# Altium schematic sheet Boost_Section.SchDoc
size A; DocumentNumber: 4; SheetNumber: 4; SheetTotal: 6
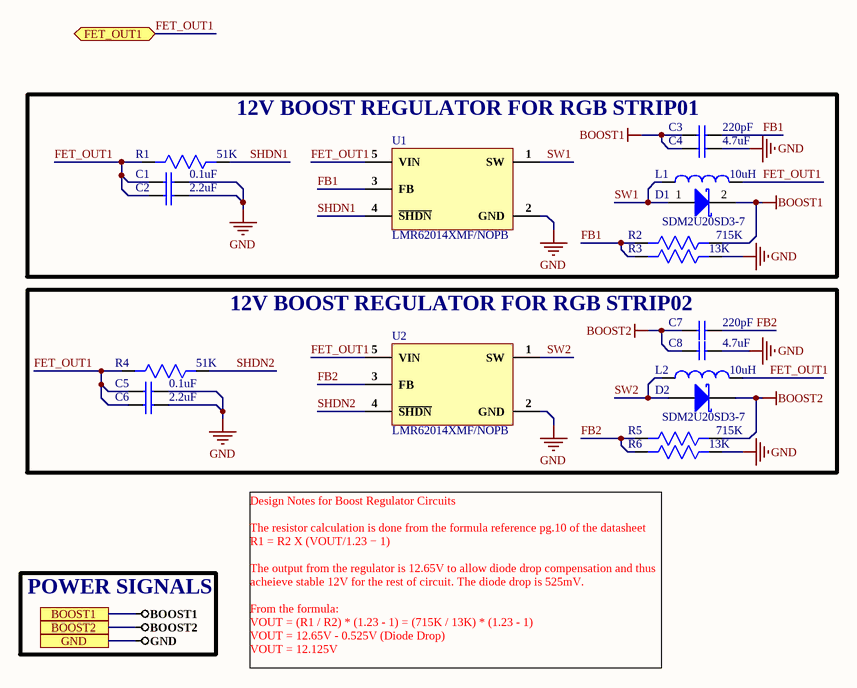
[diagram p0: Boost_Section.SchDoc]

## Parts
C1  0.1uF  [CAP 0201]
C2  2.2uF  [Cap0402]
C3  220pF  [CAP 0201]
C4  4.7uF  [Cap0603]
C5  0.1uF  [CAP 0201]
C6  2.2uF  [Cap0402]
C7  220pF  [CAP 0201]
C8  4.7uF  [Cap0603]
D1  SDM2U20SD3-7  [SDM2U20SD3-7]
D2  SDM2U20SD3-7  [SDM2U20SD3-7]
L1  10uH  [SPM5012T-100M-LR]
L2  10uH  [SPM5012T-100M-LR]
R1  51K  [Res-0201]
R2  715K  [Res-0201]
R3  13K  [Res-0201]
R4  51K  [Res-0201]
R5  715K  [Res-0201]
R6  13K  [Res-0201]
U1  LMR62014XMF/NOPB  [SOT23-5]
U2  LMR62014XMF/NOPB  [SOT23-5]

## Blocks framed on the sheet
12V BOOST REGULATOR FOR RGB STRIP01: C1-C4 D1 L1 R1-R3 U1
12V BOOST REGULATOR FOR RGB STRIP02: C5-C8 D2 L2 R4-R6 U2

## Ports
BOOST1, BOOST2, FET_OUT1 (bidir), GND

## Nets
BOOST1: C3.1 C4.1 D1.2(K) R2.2 ; port BOOST1
BOOST2: C7.1 C8.1 D2.2(K) R5.2 ; port BOOST2
GND: C1.2 C2.2 C4.2 C5.2 C6.2 C8.2 R3.2 R6.2 U1.2(GND) U2.2(GND) ; port GND
FB1: C3.2 R2.1 R3.1 U1.3(FB)
FB2: C7.2 R5.1 R6.1 U2.3(FB)
FET_OUT1: C1.1 C2.1 C5.1 C6.1 L1.2 L2.2 R1.1 R4.1 U1.5(VIN) U2.5(VIN) ; port FET_OUT1
SHDN1: R1.2 U1.4(~{SH}~{DN})
SHDN2: R4.2 U2.4(~{SH}~{DN})
SW1: D1.1(A) L1.1 U1.1(SW)
SW2: D2.1(A) L2.1 U2.1(SW)

## Notes on the sheet
- POWER SIGNALS
- Design Notes for Boost Regulator Circuits
  The resistor calculation is done from the formula reference pg.10 of the datasheet
  R1 = R2 X (VOUT/1.23 − 1)
  The output from the regulator is 12.65V to allow diode drop compensation and thus acheieve stable 12V for the rest of circuit. The diode drop is 525mV.
  From the formula:
  VOUT = (R1 / R2) * (1.23 - 1) = (715K / 13K) * (1.23 - 1)
  VOUT = 12.65V - 0.525V (Diode Drop)
  VOUT = 12.125V

## Library data of the parts
C1 C5 = GRM033R61E104KE14D: CAP CER 0.1UF 25V X5R 0201; Manufacturer: Murata; Capacitance: 100nF; Tolerance: 10%; Supplier 1: Mouser; Manufacturer Part Number: GRM033R61E104KE14D; RoHS: Yes; Category: Ceramic Capacitors; Stock 1: 19728; Pricing 1: 1=0.12000, 10=0.05600, 50=0.05600, 100=0.02500, 1000=0.01400, 10000=0.01100 (USD); Mount: Surface Mount; Case/Package: 0201; Case Code (Metric): 0603; Case Code (Imperial): 0201; Weight: 1.2E-05oz; Min Operating Temperature: -55°C; Max Operating Temperature: 85°C; Packaging: Tape and Reel; Voltage Rating: 25V; Dielectric: X5R; Termination: SMD/SMT; Resistor Type: Ceramic; Voltage Rating (DC): 25V; Package Quantity: 15000; Length: 0.024inch; Width: 0.012inch; Height: 0.3mm; Thickness: 0.013inch; Lead Free: Lead Free; RoHS Compliant: Yes; ComponentLink1URL: http://www.farnell.com/datasheets/2867843.pdf?src-supplier=Farnell; ComponentLink1Description: http://www.farnell.com/datasheets/2867843.pdf?src-supplier=Farnell; ComponentLink2URL: http://www.mouser.com/ds/2/281/c02e-2905.pdf?src-supplier=Mouser; ComponentLink2Description: http://www.mouser.com/ds/2/281/c02e-2905.pdf?src-supplier=Mouser; ComponentLink3URL: http://search.murata.co.jp/Ceramy/image/img/A01X/G101/ENG/GRM033R61E104KE14-01.pdf?src-supplier=Digi-Key; ComponentLink3Description: http://search.murata.co.jp/Ceramy/image/img/A01X/G101/ENG/GRM033R61E104KE14-01.pdf?src-supplier=Digi-Key; ComponentLink4URL: http://www.farnell.com/datasheets/2867843.pdf?src-supplier=Newark; ComponentLink4Description: http://www.farnell.com/datasheets/2867843.pdf?src-supplier=Newark; Supplier Part Number 1: 81-GRM033R61E104KE4D
C2 C6 = C1005X5R1E225KT000E: CAP CER 2.2UF 25V X5R 0402; Manufacturer: TDK; Manufacturer Part Number: C1005X5R1E225K050BC; Dielectric Material: Ceramic; Tolerance: 10%; Supplier 1: Digi-Key; RoHS: Yes; Category: Ceramic Capacitors; Stock 1: 655450; Pricing 1: 1=0.31000, 10=0.21000, 50=0.13980, 100=0.11890, 500=0.08390, 1000=0.07342, 2500=0.06992, 5000=0.06468 (USD); Mount: Surface Mount; Case/Package: 0402; Case Code (Imperial): 0402; Case Code (Metric): 1005; Weight: 2.3E-05oz; Min Operating Temperature: -55°C; Max Operating Temperature: 85°C; Capacitance: 2.2uF; Voltage Rating (DC): 25V; Packaging: Tape and Reel; Package Quantity: 1; Voltage Rating: 25V; Dielectric: X5R; Termination: SMD/SMT; Resistor Type: Ceramic; Series: C; Length: 1mm; Width: 0.5mm; Height: 0.5mm; Thickness: 0.022inch; Depth: 0.5mm; REACH SVHC: No SVHC; Lead Free: Lead Free; RoHS Compliant: Yes; ComponentLink1URL: https://datasheet.ciiva.com/24217/c1005x5r1e225k050bc-264404-24217075.pdf?src-supplier=Mouser; ComponentLink1Description: https://datasheet.ciiva.com/24217/c1005x5r1e225k050bc-264404-24217075.pdf?src-supplier=Mouser; ComponentLink2URL: https://datasheet.ciiva.com/6276/tdkmlcccaprange-6276808.pdf?src-supplier=Digi-Key; ComponentLink2Description: https://datasheet.ciiva.com/6276/tdkmlcccaprange-6276808.pdf?src-supplier=Digi-Key; ComponentLink3URL: https://datasheet.ciiva.com/6276/tdkmlcccaprange-6276806.pdf?src-supplier=Digi-Key; ComponentLink3Description: https://datasheet.ciiva.com/6276/tdkmlcccaprange-6276806.pdf?src-supplier=Digi-Key; ComponentLink4URL: https://datasheet.ciiva.com/6276/tdkmlcccaprange-6276810.pdf?src-supplier=Digi-Key; ComponentLink4Description: https://datasheet.ciiva.com/6276/tdkmlcccaprange-6276810.pdf?src-supplier=Digi-Key; Supplier Part Number 1: 445-9090-1-ND
C3 C7 = C0603X7R221KGT: 50V 220pF X7R ±10% 0201 Multilayer Ceramic Capacitors MLCC - SMD/SMT ROHS; Manufacturer: Darfon Elec; Manufacturer Part No:: C0603X7R221KGT; Value: 220pF; Footprint: 0201; ComponentLink1Description: New link; ComponentLink1URL: https://www.lcsc.com/product-detail/Multilayer-Ceramic-Capacitors-MLCC-SMD-SMT_Darfon-Elec-C0603X7R221KGT_C258475.html
C4 C8 = C1608X5R1E475K080AC: CAP CER 4.7UF 25V X5R 0603; Manufacturer: TDK; Dielectric Material: Ceramic; Tolerance: 10%; Supplier 1: Digi-Key; Manufacturer Part Number: C1608X5R1E475K080AC; RoHS: Yes; Category: Ceramic Capacitors; Stock 1: 495198; Pricing 1: 1=0.36000, 10=0.25000, 50=0.17460, 100=0.14970, 500=0.11230, 1000=0.09483 (USD); Mount: Surface Mount; Case/Package: 0603; Case Code (Metric): 1608; Case Code (Imperial): 0603; Weight: 7.1E-05oz; Min Operating Temperature: -55°C; Max Operating Temperature: 85°C; Termination: SMD/SMT; Packaging: Tape and Reel; Capacitance: 4.7uF; Voltage Rating: 25V; Voltage Rating (DC): 25V; Package Quantity: 4000; Dielectric: X5R; Resistor Type: Ceramic; Length: 1.6mm; Width: 0.031inch; Height: 0.8mm; Thickness: 0.039inch; Depth: 0.8mm; REACH SVHC: No SVHC; Lead Free: Lead Free; ComponentLink1URL: https://datasheet.ciiva.com/48587/6print-detail-pdf-phplangenpart-noc1608x5r1e475k080acimp-unit-xmhz-48587141.pdf?src-supplier=Onlinecomponents.com; ComponentLink1Description: https://datasheet.ciiva.com/48587/6print-detail-pdf-phplangenpart-noc1608x5r1e475k080acimp-unit-xmhz-48587141.pdf?src-supplier=Onlinecomponents.com; ComponentLink2URL: https://datasheet.ciiva.com/24216/mlcc-commercial-general-en-24216326.pdf?src-supplier=Mouser; ComponentLink2Description: https://datasheet.ciiva.com/24216/mlcc-commercial-general-en-24216326.pdf?src-supplier=Mouser; ComponentLink3URL: https://datasheet.ciiva.com/48671/mlcc-commercial-general-en-48671304.pdf?src-supplier=Avnet; ComponentLink3Description: https://datasheet.ciiva.com/48671/mlcc-commercial-general-en-48671304.pdf?src-supplier=Avnet; Supplier Part Number 1: 445-9050-1-ND
D1 D2 = SDM2U20SD3-7: DIODE SCHOTTKY 20V 2A SOD323; Manufacturer: Diodes; Supplier 1: Digi-Key; Manufacturer Part Number: SDM2U20SD3-7; RoHS: Yes; Category: Rectifier Diodes; Stock 1: 6; Pricing 1: 1=0.47000, 10=0.35200, 100=0.19930, 500=0.13200, 1000=0.10120 (USD); Mount: Surface Mount; Packaging: Cut Tape; Average Rectified Current: 2A; Max Reverse Voltage (DC): 20V; RoHS Compliant: Yes; ComponentLink1URL: http://www.mouser.com/ds/2/115/SDM2U20SD3-537776.pdf?src-supplier=Mouser; ComponentLink1Description: http://www.mouser.com/ds/2/115/SDM2U20SD3-537776.pdf?src-supplier=Mouser; ComponentLink2URL: https://www.diodes.com/assets/Datasheets/SDM2U20SD3.pdf?src-supplier=Digi-Key; ComponentLink2Description: https://www.diodes.com/assets/Datasheets/SDM2U20SD3.pdf?src-supplier=Digi-Key; ComponentLink3URL: http://diodes.com/datasheets/SDM2U20SD3.pdf?src-supplier=Avnet; ComponentLink3Description: http://diodes.com/datasheets/SDM2U20SD3.pdf?src-supplier=Avnet; Supplier Part Number 1: SDM2U20SD3-7DICT-ND
L1 L2 = SPM5012T-100M-LR: FIXED IND 10UH 1.3A 390.5MOHM SM; Manufacturer: TDK; Core Material: Metal; Saturation Current: 2.2A; Shielding: Shielded; DC Resistance (DCR): 390.5mR; Test Frequency: 100kHz; Tolerance: 20%; Supplier 1: Digi-Key; Manufacturer Part Number: SPM5012T-100M-LR; RoHS: Yes; Category: Fixed Inductors; Stock 1: 765; Pricing 1: 1=1.50000, 10=1.39400, 25=1.28720, 50=1.07240, 100=1.00820, 250=0.90088, 500=0.77220 (USD); Mount: Surface Mount; Case/Package: Nonstandard; Min Operating Temperature: -40°C; Max Operating Temperature: 125°C; Packaging: Tape and Reel; Resistor Type: Wirewound; Inductance: 10uH; Current Rating: 1.3A; Length: 0.126inch; Width: 0.118inch; Height - Seated (Max): 0.047inch; RoHS Compliant: Yes; ComponentLink1URL: https://product.tdk.com/info/en/catalog/datasheets/inductor_commercial_power_spm5012-lr_en.pdf?src-supplier=Digi-Key; ComponentLink1Description: https://product.tdk.com/info/en/catalog/datasheets/inductor_commercial_power_spm5012-lr_en.pdf?src-supplier=Digi-Key; Supplier Part Number 1: 445-174487-1-ND
R1 R4 = 0201WMF5102TEE: 51kΩ 0201 Chip Resistor; Manufacturer: Uni Royal; Manufacturer Part No:: 0201WMF5102TEE; Value: 51K; Footprint: 0201; ComponentLink1Description: New link; ComponentLink1URL: https://www.lcsc.com/product-detail/Chip-span-style-background-color-ff0-Resistor-span-Surface-Mount_UNI-ROYAL-Uniroyal-Elec-0201WMF5102TEE_C473471.html
R2 R5 = 0201WMF7153TEE: 715kΩ 0201 Chip Resistor; Manufacturer: Uni Royal; Manufacturer Part No:: 0201WMF7153TEE; Footprint: 0201; Value: 715K; ComponentLink1Description: New link; ComponentLink1URL: https://www.lcsc.com/product-detail/Chip-Resistor-Surface-Mount_UNI-ROYAL-Uniroyal-Elec-0201WMF7153TEE_C620454.html
R3 R6 = NQ01WMJ0133TEE: 13kΩ 0201 Chip Resistor; Manufacturer: Uni Royal; Manufacturer Part No:: NQ01WMJ0133TEE; Footprint: 0201; Value: 13K; ComponentLink1Description: New link; ComponentLink1URL: https://lcsc.com/product-detail/Chip-Resistor-Surface-Mount_UNI-ROYAL-Uniroyal-Elec-NQ01WMJ0133TEE_C965341.html
U1 U2 = LMR62014XMF/NOPB: IC REG BOOST ADJ 2A SOT23-5; Manufacturer: TI National Semiconductor; Output Type: Adjustable; Output Configuration: Positive; Switching Frequency: 1.6MHz; Max Output Current: 1.4A; Min Input Voltage: 2.7V; Max Input Voltage: 14V; Number of Outputs: 1; Output Voltage: 20V; Quiescent Current: 2mA; Min Output Voltage: 3V; Synchronous Rectifier: No; Supplier 1: Digi-Key; Manufacturer Part Number: LMR62014XMF/NOPB; RoHS: Yes; Category: Power Supply Modules; Stock 1: 5493; Pricing 1: 1=0.96000, 10=0.86000, 25=0.81600, 100=0.67040, 250=0.62672, 500=0.55384 (USD); Mount: Surface Mount; Case/Package: SOT-23-5; Number of Pins: 5; Contact Plating: Tin,Matte; Min Operating Temperature: -40°C; Max Operating Temperature: 125°C; Output Current: 1.4A; Packaging: Tape and Reel; Package Quantity: 1000; Topology: Boost; Max Output Voltage: 20V; Radiation Hardening: No; REACH SVHC: No SVHC; Lead Free: Lead Free; ComponentLink1URL: https://datasheet.ciiva.com/3231/lmr62014-3231410.pdf?src-supplier=Avnet; ComponentLink1Description: https://datasheet.ciiva.com/3231/lmr62014-3231410.pdf?src-supplier=Avnet; ComponentLink2URL: https://datasheet.ciiva.com/23854/1777788-23854326.pdf?src-supplier=Newark; ComponentLink2Description: https://datasheet.ciiva.com/23854/1777788-23854326.pdf?src-supplier=Newark; ComponentLink3URL: https://datasheet.ciiva.com/4879/snvs735a-74121-4879731.pdf?src-supplier=Mouser; ComponentLink3Description: https://datasheet.ciiva.com/4879/snvs735a-74121-4879731.pdf?src-supplier=Mouser; ComponentLink4URL: https://datasheet.ciiva.com/22669/1716576-22669414.pdf?src-supplier=Element14; ComponentLink4Description: https://datasheet.ciiva.com/22669/1716576-22669414.pdf?src-supplier=Element14; ComponentLink5URL: https://datasheet.ciiva.com/6603/lmr62014-6603804.pdf?src-supplier=Digi-Key; ComponentLink5Description: https://datasheet.ciiva.com/6603/lmr62014-6603804.pdf?src-supplier=Digi-Key; ComponentLink6URL: https://datasheet.ciiva.com/6603/lmr62014-6603807.pdf?src-supplier=Digi-Key; ComponentLink6Description: https://datasheet.ciiva.com/6603/lmr62014-6603807.pdf?src-supplier=Digi-Key; Supplier Part Number 1: LMR62014XMF/NOPBCT-ND